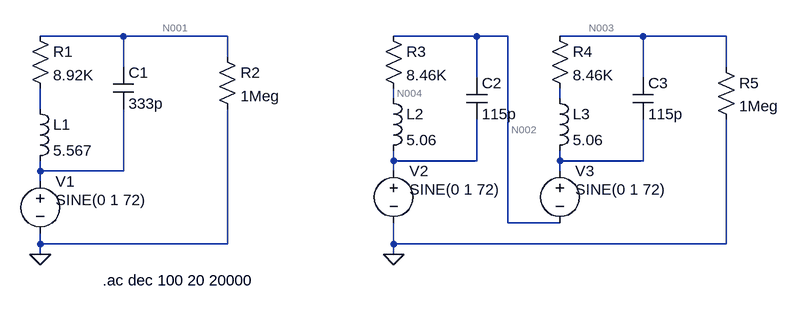
[diagram p0: schematic Draft1.asc]
Draft1.asc, the LTspice schematic file:
Version 4.1
SHEET 1 1172 680
WIRE 144 -64 16 -64
WIRE 304 -64 144 -64
WIRE 688 -64 560 -64
WIRE 736 -64 688 -64
WIRE 944 -64 816 -64
WIRE 1072 -64 944 -64
WIRE 304 -32 304 -64
WIRE 144 -16 144 -64
WIRE 1072 -16 1072 -64
WIRE 688 0 688 -64
WIRE 944 0 944 -64
WIRE 560 32 560 16
WIRE 816 32 816 16
WIRE 16 48 16 16
WIRE 560 128 560 112
WIRE 688 128 688 64
WIRE 688 128 560 128
WIRE 816 128 816 112
WIRE 944 128 944 64
WIRE 944 128 816 128
WIRE 16 144 16 128
WIRE 144 144 144 48
WIRE 144 144 16 144
WIRE 560 144 560 128
WIRE 816 144 816 128
WIRE 16 160 16 144
WIRE 736 224 736 -64
WIRE 816 224 736 224
WIRE 16 256 16 240
WIRE 304 256 304 48
WIRE 304 256 16 256
WIRE 560 256 560 224
WIRE 1072 256 1072 64
WIRE 1072 256 560 256
WIRE 16 272 16 256
WIRE 560 272 560 256
FLAG 16 272 0
FLAG 560 272 0
SYMBOL voltage 16 144 R0
WINDOW 3 24 44 Left 2
WINDOW 39 0 0 Left 0
SYMATTR InstName V1
SYMATTR Value SINE(0 1 72)
SYMATTR Value2 AC 1 0
SYMBOL ind 0 32 R0
SYMATTR InstName L1
SYMATTR Value 5.567
SYMBOL res 0 -80 R0
SYMATTR InstName R1
SYMATTR Value 8.92K
SYMBOL cap 128 -16 R0
SYMATTR InstName C1
SYMATTR Value 333p
SYMBOL res 288 -48 R0
SYMATTR InstName R2
SYMATTR Value 1Meg
SYMBOL voltage 560 128 R0
WINDOW 3 24 44 Left 2
WINDOW 39 0 0 Left 0
SYMATTR InstName V2
SYMATTR Value SINE(0 1 72)
SYMATTR Value2 AC 1 0
SYMBOL ind 544 16 R0
SYMATTR InstName L2
SYMATTR Value 5.06
SYMBOL res 544 -80 R0
SYMATTR InstName R3
SYMATTR Value 8.46K
SYMBOL cap 672 0 R0
SYMATTR InstName C2
SYMATTR Value 115p
SYMBOL voltage 816 128 R0
WINDOW 3 24 44 Left 2
WINDOW 39 0 0 Left 0
SYMATTR InstName V3
SYMATTR Value SINE(0 1 72)
SYMATTR Value2 AC 1 0
SYMBOL ind 800 16 R0
SYMATTR InstName L3
SYMATTR Value 5.06
SYMBOL res 800 -80 R0
SYMATTR InstName R4
SYMATTR Value 8.46K
SYMBOL cap 928 0 R0
SYMATTR InstName C3
SYMATTR Value 115p
SYMBOL res 1056 -32 R0
SYMATTR InstName R5
SYMATTR Value 1Meg
TEXT 112 312 Left 2 !.ac dec 100 20 20000

The netlist it stands for:
* Draft1.asc
V1 N009 0 SINE(0 1 72) AC 1 0
L1 N006 N009 5.567
R1 N001 N006 8.92K
C1 N001 N009 333p
R2 N001 0 1Meg
V2 N007 0 SINE(0 1 72) AC 1 0
L2 N004 N007 5.06
R3 N002 N004 8.46K
C2 N002 N007 115p
V3 N008 N002 SINE(0 1 72) AC 1 0
L3 N005 N008 5.06
R4 N003 N005 8.46K
C3 N003 N008 115p
R5 N003 0 1Meg
.ac dec 100 20 20000
.backanno
.end

* Results of the author's LTspice run, read from the files saved beside the schematic
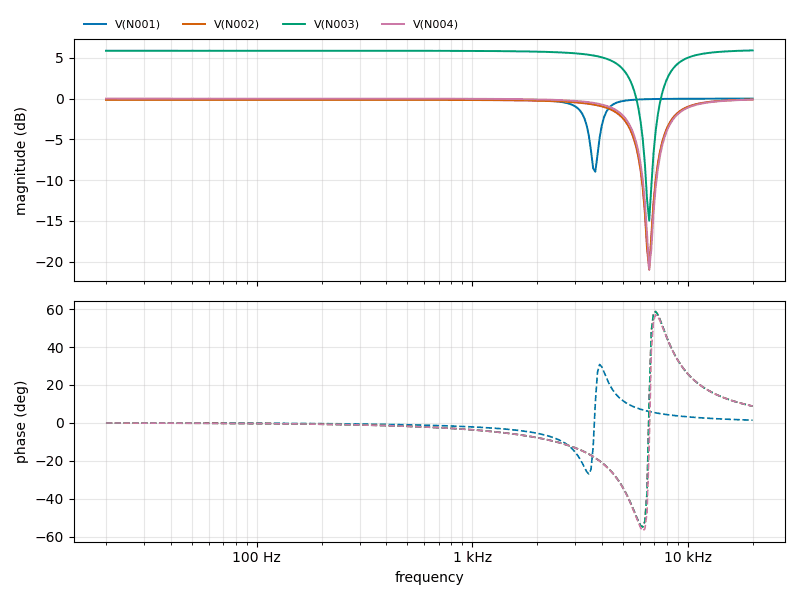
[diagram p1: AC Analysis of Draft1.asc, plotted from the saved traces]
* AC Analysis, 1 run:
*   V(N001): -0.08 dB at 20 Hz, -0.00 dB at 20 kHz, peak -0.00 dB at 20 kHz, 3 dB below the peak at 4.017 kHz
*   V(N002): -0.15 dB at 20 Hz, -0.11 dB at 20 kHz, peak -0.11 dB at 20 kHz, 3 dB below the peak at 8.181 kHz
*   V(N003): 5.87 dB at 20 Hz, 5.91 dB at 20 kHz, peak 5.91 dB at 20 kHz, 3 dB below the peak at 8.181 kHz
*   V(N004): -0.00 dB at 20 Hz, -0.12 dB at 20 kHz, peak -0.00 dB at 20 Hz, 3 dB below the peak at 5.313 kHz